# Altium schematic sheet probe-schematic.SchDoc
size A4; SheetNumber: 1; SheetTotal: 1
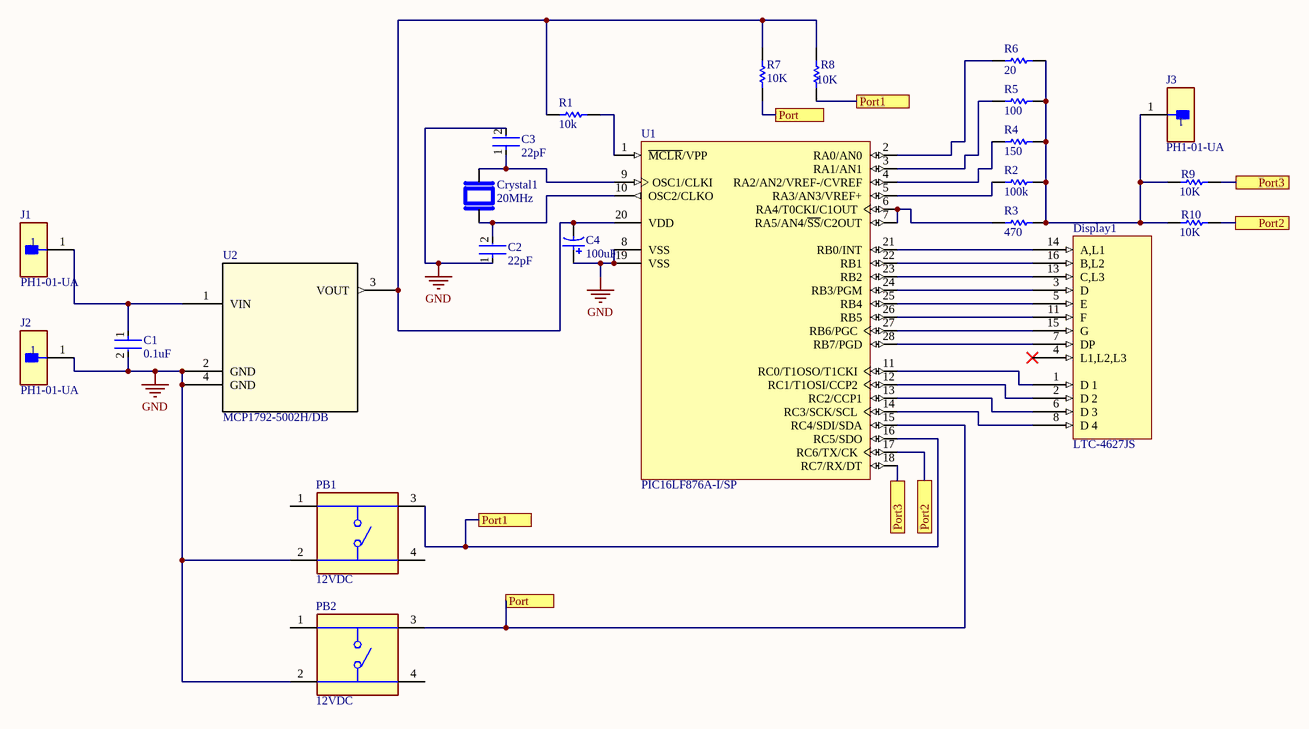
[diagram p0: probe-schematic.SchDoc]

## Parts
C1  0.1uF  [FP-C1206C-EB-MFG]
C2  22pF  [FP-GRM31A-0_2-e0_3_0_95-IPC_B]
C3  22pF  [FP-GRM31A-0_2-e0_3_0_95-IPC_B]
C4  100uF  [PNSC-HA-V-D_V]
Crystal1  20MHz  [XTAL_ABLS-20.000MHz-20-B-3-H-T]
Display1  LTC-4627JS  [7-seg]
J1  PH1-01-UA  [FP-PH1-01-UA-MFG]
J2  PH1-01-UA  [FP-PH1-01-UA-MFG]
J3  PH1-01-UA  [FP-PH1-01-UA-MFG]
PB1  12VDC  [SW_TS04-66-55-BK-100-SMT]
PB2  12VDC  [SW_TS04-66-55-BK-100-SMT]
R1  10k  [RESC3216X50X50LL20T25]
R2  100k  [RESC3216X50X50LL20T25]
R3  470  [RESC3216X50X50LL20T25]
R4  150  [RESC3216X50X50LL20T25]
R5  100  [RESC3216X50X50LL20T25]
R6  20  [RESC3216X50X50LL20T25]
R7  10K  [RESC3216X50X50LL20T25]
R8  10K  [RESC3216X50X50LL20T25]
R9  10K  [RESC3216X50X50LL20T25]
R10  10K  [RESC3216X50X50LL20T25]
U1  PIC16LF876A-I/SP  [SPDIP300-SP28]
U2  MCP1792-5002H/DB  [SOT_MCP1792-5002HDB_MCH]

## Ports
Port1 (see probe[2C]), Port1 (see probe[3A]), Port2 (see probe[3C]), Port2 (see probe[4B]), Port3 (see probe[3C]), Port3 (see probe[4B]), Port (see probe[2C]), Port (see probe[3A])

## Nets
GND: C1.2 C2.1 C3.2 C4.1 J2.1 PB1.2 PB2.2 U1.8(VSS) U1.19(VSS) U2.2(GND) U2.4(GND)
Port: PB2.3 R7.1 U1.15(RC4/SDI/SDA) ; port Port
Port1: PB1.3 R8.1 U1.16(RC5/SDO) ; port Port1
Port2: R10.2 U1.17(RC6/TX/CK) ; port Port2
Port3: R9.2 U1.18(RC7/RX/DT) ; port Port3
NetC1_1: C1.1 J1.1 U2.1(VIN)
NetC2_2: C2.2 Crystal1.1 U1.10(OSC2/CLKO)
NetC3_1: C3.1 Crystal1.2 U1.9(OSC1/CLKI)
NetC4_2: C4.2 R1.1 R7.2 R8.2 U1.20(VDD) U2.3(VOUT)
NetDisplay1_1: Display1.1(D_1) U1.11(RC0/T1OSO/T1CKI)
NetDisplay1_2: Display1.2(D_2) U1.12(RC1/T1OSI/CCP2)
NetDisplay1_3: Display1.3(D) U1.24(RB3/PGM)
NetDisplay1_5: Display1.5(E) U1.25(RB4)
NetDisplay1_6: Display1.6(D_3) U1.13(RC2/CCP1)
NetDisplay1_7: Display1.7(DP) U1.28(RB7/PGD)
NetDisplay1_8: Display1.8(D_4) U1.14(RC3/SCK/SCL)
NetDisplay1_11: Display1.11(F) U1.26(RB5)
NetDisplay1_13: Display1.13(C,L3) U1.23(RB2)
NetDisplay1_14: Display1.14(A,L1) U1.21(RB0/INT)
NetDisplay1_15: Display1.15(G) U1.27(RB6/PGC)
NetDisplay1_16: Display1.16(B,L2) U1.22(RB1)
NetJ3_1: J3.1 R2.2 R3.2 R4.2 R5.2 R6.2 R9.1 R10.1
NetR1_2: R1.2 U1.1(~{MCLR}/VPP)
NetR2_1: R2.1 U1.5(RA3/AN3/VREF+)
NetR3_1: R3.1 U1.6(RA4/T0CKI/C1OUT) U1.7(RA5/AN4/~{SS}/C2OUT)
NetR4_1: R4.1 U1.4(RA2/AN2/VREF-/CVREF)
NetR5_1: R5.1 U1.3(RA1/AN1)
NetR6_1: R6.1 U1.2(RA0/AN0)

Not connected (* = marked no-connect by the designer): Display1 4(L1,L2,L3)* 9(NO_CON) 10(NO_PIN) 12(NO_PIN); PB1 1 4; PB2 1 4

## Library data of the parts
C1 = CMP-03020-000153-1: CAP CER 0.1UF 100V X7R 1206; Manufacturer: KEMET; Manufacturer Part Number: C1206C104K1RACTU; Value: 0.10 μF; Tolerance: 0.1; Material: Ceramic; Temperature Coefficient: 15%; Automotive Grade: Grade 0; Voltage Rating: 100 V; Automotive: Yes; Ipc Land Pattern Name: CAPC320160X78; Device Class L1: Passive Components; ComponentLink2Description: Datasheet; Temperature Range Low: -55°C; Category: Cap; Octopart: https://octopart.com/c1206c104k1ractu-kemet-89521; Height: 0.88mm; Lead Free: Yes; Digikey Description: CAP CER 0.1UF 100V X7R 1206; Mouser Description: CAP CER 0.1UF 100V X7R 1206; Device Class L3: Ceramic Capacitors; Device Class L2: Capacitors; ComponentLink2URL: https://content.kemet.com/datasheets/KEM_C1007_X8R_ULTRA_150C_SMD.pdf; Temperature Range High: +150°C; Temperature Characteristic: X7R; RoHS: TRUE; Capacitance: 0.10 μF; Package: C1206C-EB; Temperature: -55°C to +150°C
C2 C3 = CMP-06035-046186-1: Chip Multilayer Ceramic Capacitors for General Purpose, 1206, 22pF, U2J, -750ppm/°C, 5%, 1kV; Height: 1mm; Case Code (Metric): 3216; Thickness: 0.039inch; Min Operating Temperature: -55°C; Packaging: Tape and Reel; Max Operating Temperature: 125°C; Tolerance: 5%; REACH SVHC: No SVHC; Capacitance: 22pF; Dielectric: U2J; Length: 3.2mm; Width: 0.063inch; Depth: 1.6mm; Voltage Rating: 1kV; Mount: Surface Mount; Voltage Rating (DC): 1kV; Package Quantity: 4000; Case/Package: 1206; Radiation Hardening: No; Case Code (Imperial): 1206; Termination: SMD/SMT
C4 = CMP-2000-06219-2: Aluminum Electrolytic Capacitor, 100 uF, +/- 20%, 16 V, 2-Pin SMD (Size Code D), -40 to 105 degC, RoHS, Tape and Reel; Manufacturer: Panasonic; Capacitance: 100µF; Rated Voltage: 16V; Type: Can; Lifetime@Temperature: 1000Hrs@105°C; Ripple Current: 70mA; Operating Temp-Max: 105°C; Manufacturer URL: http://www.panasonic.com/; Series: HA; Mounting Technology: SurfaceMount; Datasheet URL: https://industrial.panasonic.com/cdbs/www-data/pdf/RDE0000/ABA0000C11.pdf; Package URL: http://industrial.panasonic.com/cdbs/www-data/pdf/RDE0000/DME0000COL48.pdf; Operating Temp Range: -40to+105°C; Case Size/Dimension: Ø6.3x5.4mm; Package Description: 2-Pin Electrolytic Aluminum Capacitor, Body 6.6 x 6.6 mm; Datasheet Version: 03/2015; Package Reference: HA-V-D
Crystal1 = ABLS-20.000MHz-20-B-3-H-T: HC/49US (AT49) SMD LOW PROFILE CRYSTAL; MF: Abracon LLC; SnapEDA_Link: https://www.snapeda.com/parts/ABLS-20.000MHZ-20-B-3-H-T/Abracon+LLC/view-part/?ref=snap; Value: *; Purchase-URL: https://pricing.snapeda.com/search/part/ABLS-20.000MHZ-20-B-3-H-T/?ref=eda; Digi-Key_Part_Number: 535-15010-2-ND; Check_prices: https://www.snapeda.com/parts/ABLS-20.000MHZ-20-B-3-H-T/Abracon+LLC/view-part/?ref=eda; MP: ABLS-20.000MHZ-20-B-3-H-T; Package: None
Display1 = CMP-007-00036-2: LED Display 7-Segment Yellow 0.40 Inch 4-Digit Common Anode RHDP; Forward Current: 25mA; Forward Voltage: 2.6V; Max Power Dissipation: 40mW; Case/Package: DIP; Min Operating Temperature: -35°C; Pins: 16; Max Operating Temperature: 85°C
J1-J3 = CMP-42765-000003-1: CONN HEADER VERT 1POS 2.54MM; Number of Positions: 1; Voltage Rating (AC): 250V; Insulation Material: PBT; Number of Rows: 1; Connector Type: Header; Min Operating Temperature: -40°C; Packaging: Bulk; Contact Material: Brass; Mount: Through Hole; Contact Shape: Square; Contact Finish - Mating: GOLD; Series: PH1; Contact Type: Male Pin; Termination: Solder; Flammability Rating: UL94 V-0; Insulation Color: Black; Lead Free: Lead Free; Fastening Type: Pull; Max Operating Temperature: 105°C
PB1 PB2 = TS04-66-55-BK-100-SMT: 6 x 6 mm, 5.5 mm Actuator Height, 100 gf, Black, Surface Mount, SPST, Tactile Switch; MF: Same Sky; SnapEDA_Link: https://www.snapeda.com/parts/TS04-66-55-BK-100-SMT/Same+Sky/view-part/?ref=snap; Package: None; Value: *; MP: TS04-66-55-BK-100-SMT; Check_prices: https://www.snapeda.com/parts/TS04-66-55-BK-100-SMT/Same+Sky/view-part/?ref=eda
R1-R10 = CMP-2003-02544-1: Part Number: RG3216P-1002-B-T1; Manufacturer: Susumu
U1 = CMP-0115-00267-1: Enhanced FLASH Microcontroller, 8K (x14-Bit words) FLASH, 368 Bytes RAM, 28-Pin PDIP 300mil, Extended VDD Range, Industrial Temperature; ComponentAvailability: Unknown. Contact manufacturer to determine status.; PackageDescription: 28-Lead Skinny Plastic Dual In-Line (SP) - 300 mil Body [SPDIP]; DatasheetVersion: revB, Oct-2003; PackageReference: SPDIP300-SP28; PackageVersion: revBB, Aug-2009
U2 = MCP1792-5002HDB: Description; Manufacturer_Name: Microchip; Copyright: Copyright (C) 2025 Ultra Librarian. All rights reserved.; Manufacturer_Part_Number: MCP1792-5002H/DB; RefDes: RefDes; Type: Type